# Altium schematic sheet Overview.SchDoc
size A4; SheetNumber: 1; SheetTotal: 7
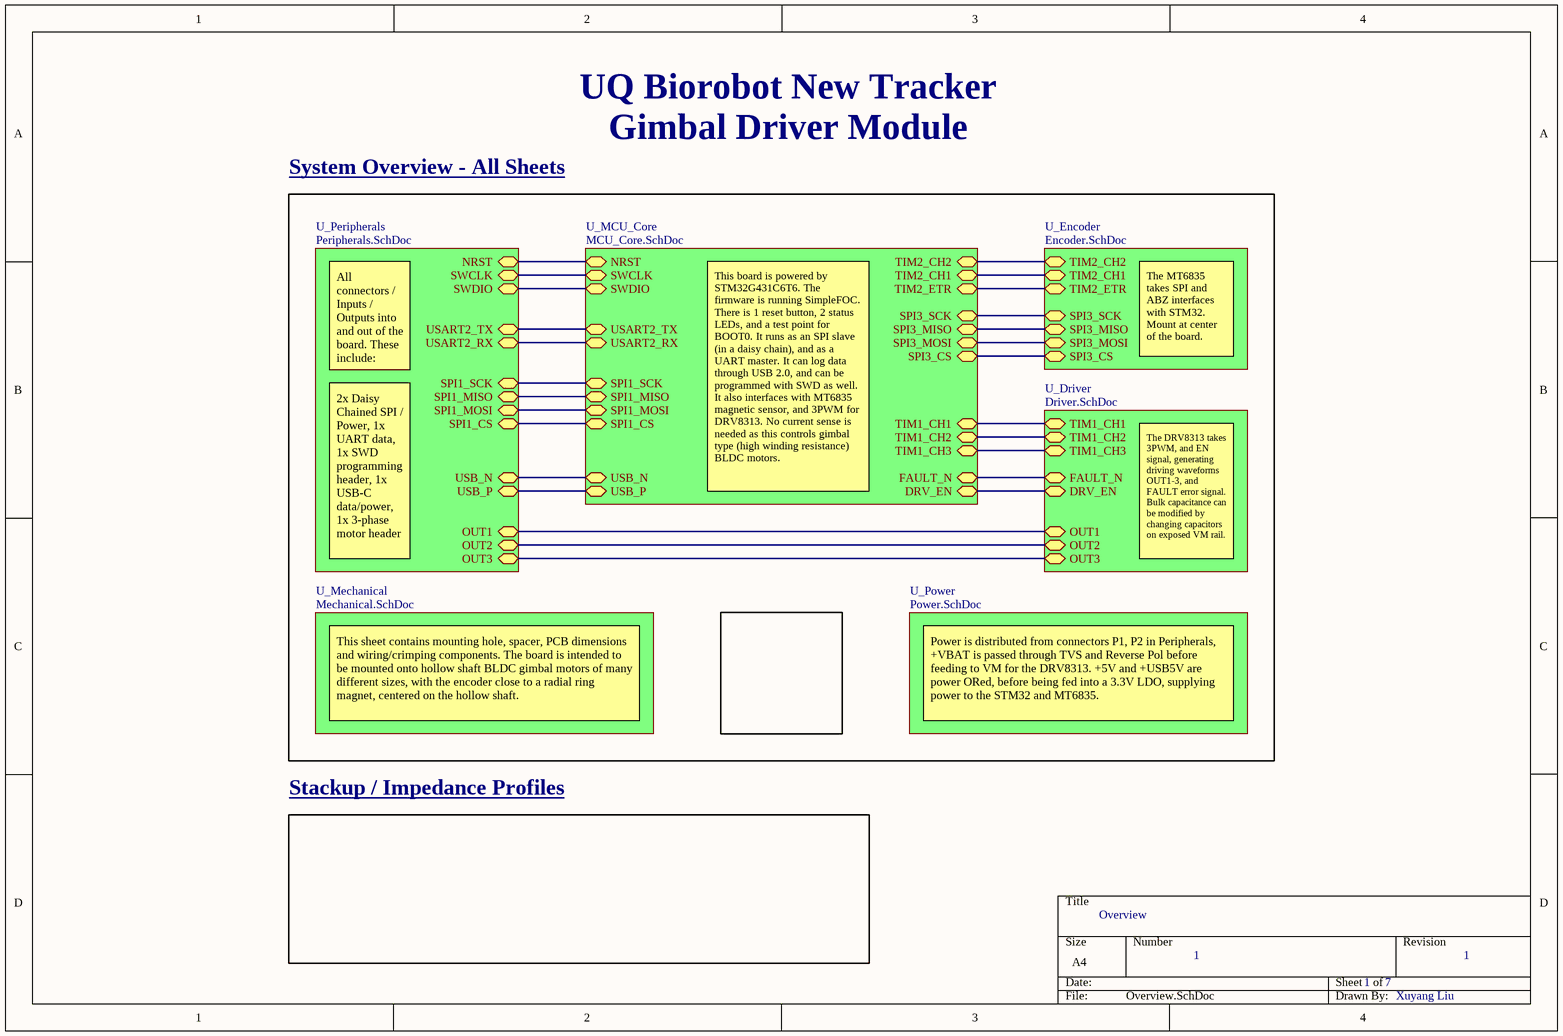
[diagram p0: Overview.SchDoc]

## Sub-sheets
U_Driver = Driver.SchDoc: FAULT_N (bidir), DRV_EN (bidir), TIM1_CH1 (bidir), TIM1_CH3 (bidir), TIM1_CH2 (bidir), OUT2 (bidir), OUT1 (bidir), OUT3 (bidir)
U_Encoder = Encoder.SchDoc: SPI3_CS (bidir), SPI3_MOSI (bidir), SPI3_MISO (bidir), SPI3_SCK (bidir), TIM2_CH2 (bidir), TIM2_CH1 (bidir), TIM2_ETR (bidir)
U_MCU_Core = MCU_Core.SchDoc: SPI3_CS (bidir), SPI3_MOSI (bidir), SPI3_MISO (bidir), SPI3_SCK (bidir), SPI1_CS (bidir), SWCLK (bidir), SWDIO (bidir), TIM1_CH3 (bidir), TIM1_CH2 (bidir), TIM1_CH1 (bidir), SPI1_MOSI (bidir), SPI1_MISO (bidir), SPI1_SCK (bidir), USART2_RX (bidir), USART2_TX (bidir), TIM2_CH2 (bidir), TIM2_CH1 (bidir), USB_N (bidir), USB_P (bidir), TIM2_ETR (bidir), NRST (bidir), FAULT_N (bidir), DRV_EN (bidir)
U_Mechanical = Mechanical.SchDoc: no entries
U_Peripherals = Peripherals.SchDoc: USB_N (bidir), USB_P (bidir), SPI1_SCK (bidir), SPI1_MOSI (bidir), SPI1_MISO (bidir), SPI1_CS (bidir), USART2_TX (bidir), USART2_RX (bidir), NRST (bidir), SWCLK (bidir), SWDIO (bidir), OUT1 (bidir), OUT3 (bidir), OUT2 (bidir)
U_Power = Power.SchDoc: no entries

## Nets
(unnamed): sheet U_MCU_Core/SPI3_CS, sheet U_Encoder/SPI3_CS
(unnamed): sheet U_MCU_Core/SPI3_MOSI, sheet U_Encoder/SPI3_MOSI
(unnamed): sheet U_MCU_Core/SPI3_MISO, sheet U_Encoder/SPI3_MISO
(unnamed): sheet U_MCU_Core/SPI3_SCK, sheet U_Encoder/SPI3_SCK
(unnamed): sheet U_MCU_Core/SPI1_CS, sheet U_Peripherals/SPI1_CS
(unnamed): sheet U_MCU_Core/SWCLK, sheet U_Peripherals/SWCLK
(unnamed): sheet U_MCU_Core/SWDIO, sheet U_Peripherals/SWDIO
(unnamed): sheet U_MCU_Core/TIM1_CH3, sheet U_Driver/TIM1_CH3
(unnamed): sheet U_MCU_Core/TIM1_CH2, sheet U_Driver/TIM1_CH2
(unnamed): sheet U_MCU_Core/TIM1_CH1, sheet U_Driver/TIM1_CH1
(unnamed): sheet U_MCU_Core/SPI1_MOSI, sheet U_Peripherals/SPI1_MOSI
(unnamed): sheet U_MCU_Core/SPI1_MISO, sheet U_Peripherals/SPI1_MISO
(unnamed): sheet U_MCU_Core/SPI1_SCK, sheet U_Peripherals/SPI1_SCK
(unnamed): sheet U_MCU_Core/USART2_RX, sheet U_Peripherals/USART2_RX
(unnamed): sheet U_MCU_Core/USART2_TX, sheet U_Peripherals/USART2_TX
(unnamed): sheet U_MCU_Core/TIM2_CH2, sheet U_Encoder/TIM2_CH2
(unnamed): sheet U_MCU_Core/TIM2_CH1, sheet U_Encoder/TIM2_CH1
(unnamed): sheet U_MCU_Core/USB_N, sheet U_Peripherals/USB_N
(unnamed): sheet U_MCU_Core/USB_P, sheet U_Peripherals/USB_P
(unnamed): sheet U_MCU_Core/TIM2_ETR, sheet U_Encoder/TIM2_ETR
(unnamed): sheet U_MCU_Core/NRST, sheet U_Peripherals/NRST
(unnamed): sheet U_MCU_Core/FAULT_N, sheet U_Driver/FAULT_N
(unnamed): sheet U_MCU_Core/DRV_EN, sheet U_Driver/DRV_EN
(unnamed): sheet U_Peripherals/OUT1, sheet U_Driver/OUT1
(unnamed): sheet U_Peripherals/OUT3, sheet U_Driver/OUT3
(unnamed): sheet U_Peripherals/OUT2, sheet U_Driver/OUT2

## Notes on the sheet
- UQ Biorobot New Tracker
- System Overview - All Sheets
- Gimbal Driver Module
- All connectors / Inputs / Outputs into and out of the board. These include:
- The MT6835 takes SPI and ABZ interfaces with STM32. Mount at center of the board.
- This board is powered by STM32G431C6T6. The firmware is running SimpleFOC. There is 1 reset button, 2 status LEDs, and a test point for BOOT0. It runs as an SPI slave (in a daisy chain), and as a UART master. It can log data through USB 2.0, and can be programmed with SWD as well. It also interfaces with MT6835 magnetic sensor, and 3PWM for DRV8313. No current sense is needed as this controls gimbal type (high winding resistance) BLDC motors.
- 2x Daisy Chained SPI / Power, 1x UART data, 1x SWD programming header, 1x USB-C data/power, 1x 3-phase motor header
- The DRV8313 takes 3PWM, and EN signal, generating driving waveforms OUT1-3, and FAULT error signal. Bulk capacitance can be modified by changing capacitors on exposed VM rail.
- This sheet contains mounting hole, spacer, PCB dimensions and wiring/crimping components. The board is intended to be mounted onto hollow shaft BLDC gimbal motors of many different sizes, with the encoder close to a radial ring magnet, centered on the hollow shaft.
- Power is distributed from connectors P1, P2 in Peripherals, +VBAT is passed through TVS and Reverse Pol before feeding to VM for the DRV8313. +5V and +USB5V are power ORed, before being fed into a 3.3V LDO, supplying power to the STM32 and MT6835.
- Stackup / Impedance Profiles
- Overview
- 1
- 1     7
- Xuyang Liu